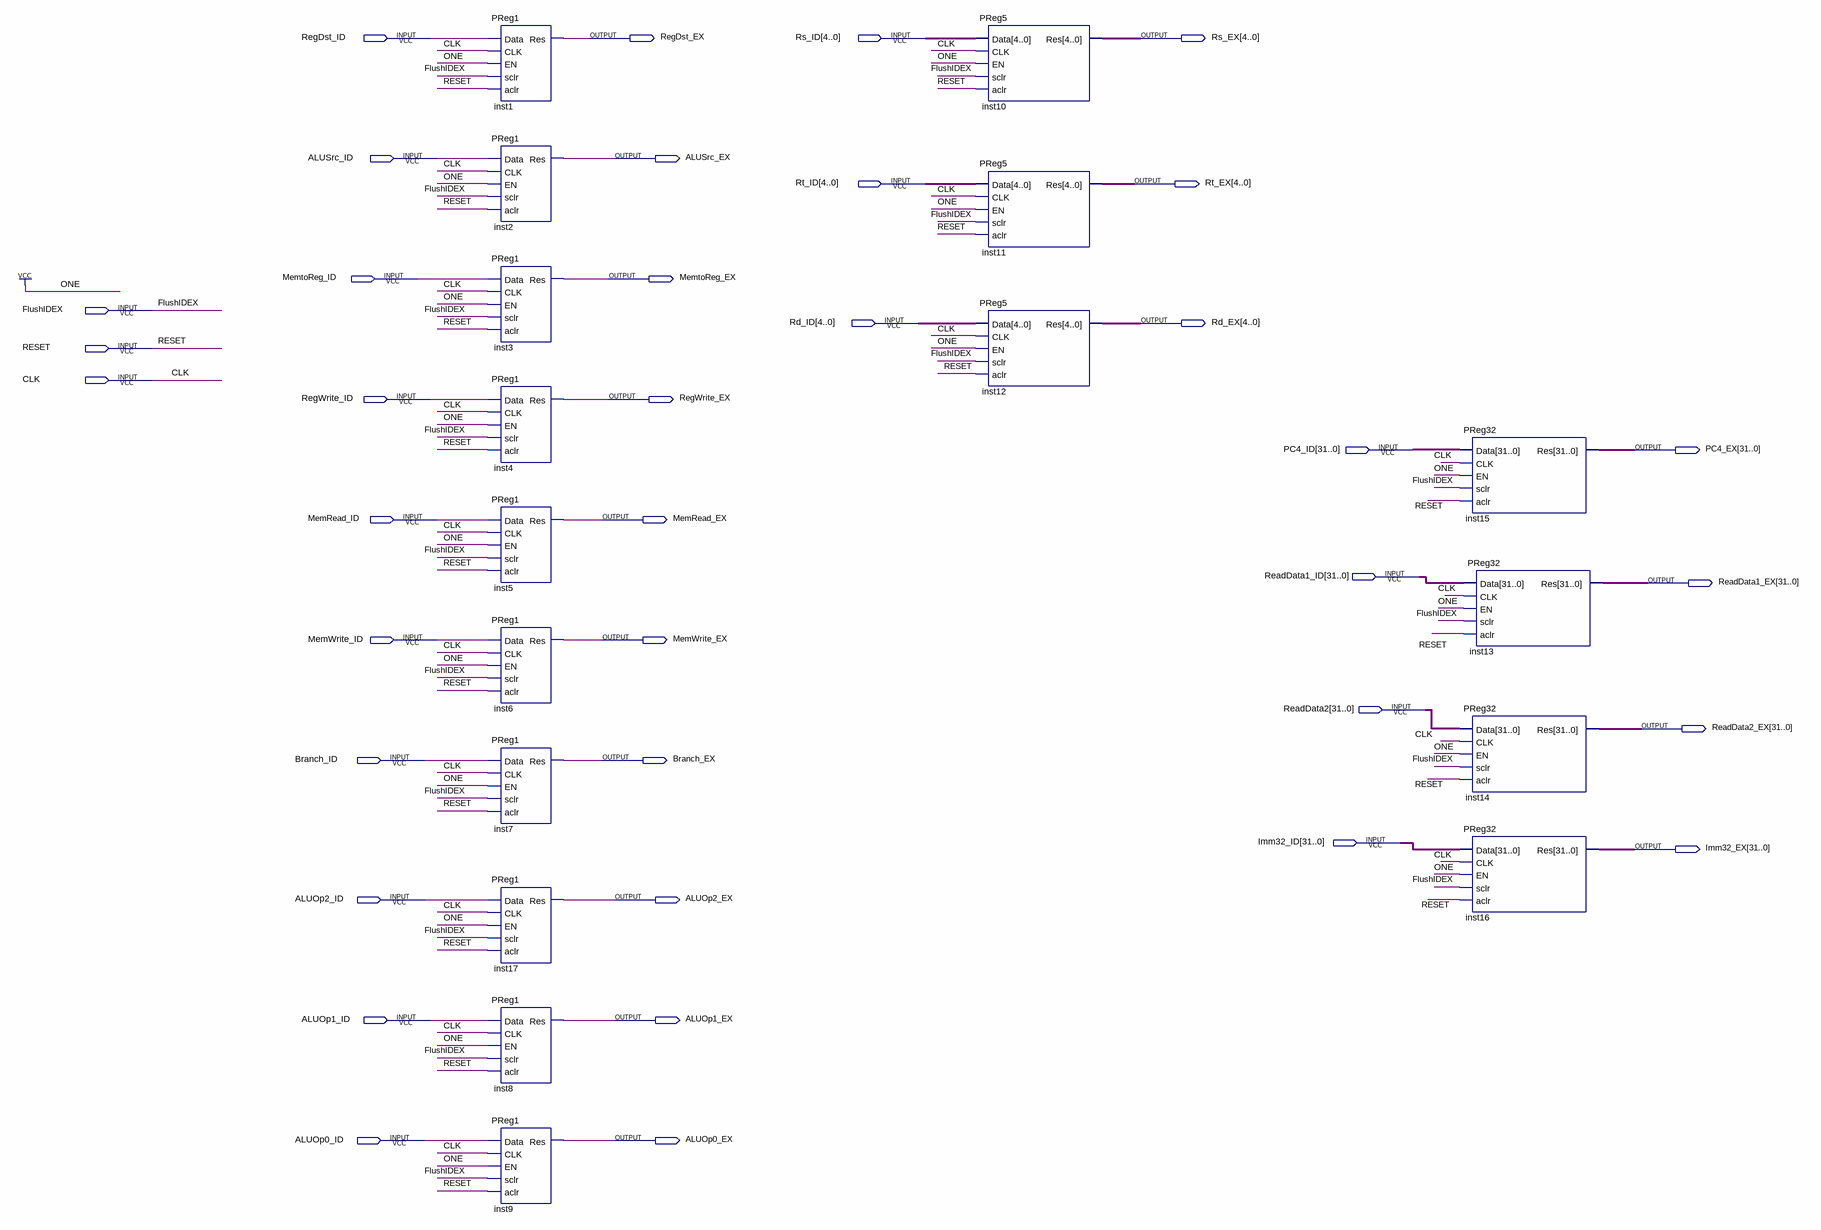
[diagram p0: schematic sheet]
// Quartus schematic ID_EX.bdf as structural Verilog: 17 symbols, 37 pins
module ID_EX (
  input  RegDst_ID,
  input  [4:0] Rs_ID,
  input  ALUSrc_ID,
  input  [4:0] Rt_ID,
  input  MemtoReg_ID,
  input  FlushIDEX,
  input  [4:0] Rd_ID,
  input  RESET,
  input  CLK,
  input  RegWrite_ID,
  input  [31:0] PC4_ID,
  input  MemRead_ID,
  input  [31:0] ReadData1_ID,
  input  MemWrite_ID,
  input  [31:0] ReadData2,
  input  Branch_ID,
  input  [31:0] Imm32_ID,
  input  ALUOp2_ID,
  input  ALUOp1_ID,
  input  ALUOp0_ID,
  output RegDst_EX,
  output [4:0] Rs_EX,
  output ALUSrc_EX,
  output [4:0] Rt_EX,
  output MemtoReg_EX,
  output [4:0] Rd_EX,
  output RegWrite_EX,
  output [31:0] PC4_EX,
  output MemRead_EX,
  output [31:0] ReadData1_EX,
  output MemWrite_EX,
  output [31:0] ReadData2_EX,
  output Branch_EX,
  output [31:0] Imm32_EX,
  output ALUOp2_EX,
  output ALUOp1_EX,
  output ALUOp0_EX
);

  PReg1 inst1 (.Data(RegDst_ID), .CLK(CLK), .EN(1'b1), .sclr(FlushIDEX), .aclr(RESET), .Res(RegDst_EX));
  PReg1 inst2 (.Data(ALUSrc_ID), .CLK(CLK), .EN(1'b1), .sclr(FlushIDEX), .aclr(RESET), .Res(ALUSrc_EX));
  PReg1 inst3 (.Data(MemtoReg_ID), .CLK(CLK), .EN(1'b1), .sclr(FlushIDEX), .aclr(RESET), .Res(MemtoReg_EX));
  PReg1 inst4 (.Data(RegWrite_ID), .CLK(CLK), .EN(1'b1), .sclr(FlushIDEX), .aclr(RESET), .Res(RegWrite_EX));
  PReg1 inst5 (.Data(MemRead_ID), .CLK(CLK), .EN(1'b1), .sclr(FlushIDEX), .aclr(RESET), .Res(MemRead_EX));
  PReg1 inst6 (.Data(MemWrite_ID), .CLK(CLK), .EN(1'b1), .sclr(FlushIDEX), .aclr(RESET), .Res(MemWrite_EX));
  PReg1 inst7 (.Data(Branch_ID), .CLK(CLK), .EN(1'b1), .sclr(FlushIDEX), .aclr(RESET), .Res(Branch_EX));
  PReg1 inst17 (.Data(ALUOp2_ID), .CLK(CLK), .EN(1'b1), .sclr(FlushIDEX), .aclr(RESET), .Res(ALUOp2_EX));
  PReg1 inst8 (.Data(ALUOp1_ID), .CLK(CLK), .EN(1'b1), .sclr(FlushIDEX), .aclr(RESET), .Res(ALUOp1_EX));
  PReg1 inst9 (.Data(ALUOp0_ID), .CLK(CLK), .EN(1'b1), .sclr(FlushIDEX), .aclr(RESET), .Res(ALUOp0_EX));
  PReg5 inst10 (.Data(Rs_ID), .CLK(CLK), .EN(1'b1), .sclr(FlushIDEX), .aclr(RESET), .Res(Rs_EX));
  PReg5 inst11 (.Data(Rt_ID), .CLK(CLK), .EN(1'b1), .sclr(FlushIDEX), .aclr(RESET), .Res(Rt_EX));
  PReg5 inst12 (.Data(Rd_ID), .CLK(CLK), .EN(1'b1), .sclr(FlushIDEX), .aclr(RESET), .Res(Rd_EX));
  PReg32 inst15 (.Data(PC4_ID), .CLK(CLK), .EN(1'b1), .sclr(FlushIDEX), .aclr(RESET), .Res(PC4_EX));
  PReg32 inst13 (.Data(ReadData1_ID), .CLK(CLK), .EN(1'b1), .sclr(FlushIDEX), .aclr(RESET), .Res(ReadData1_EX));
  PReg32 inst14 (.Data(ReadData2), .CLK(CLK), .EN(1'b1), .sclr(FlushIDEX), .aclr(RESET), .Res(ReadData2_EX));
  PReg32 inst16 (.Data(Imm32_ID), .CLK(CLK), .EN(1'b1), .sclr(FlushIDEX), .aclr(RESET), .Res(Imm32_EX));
endmodule
